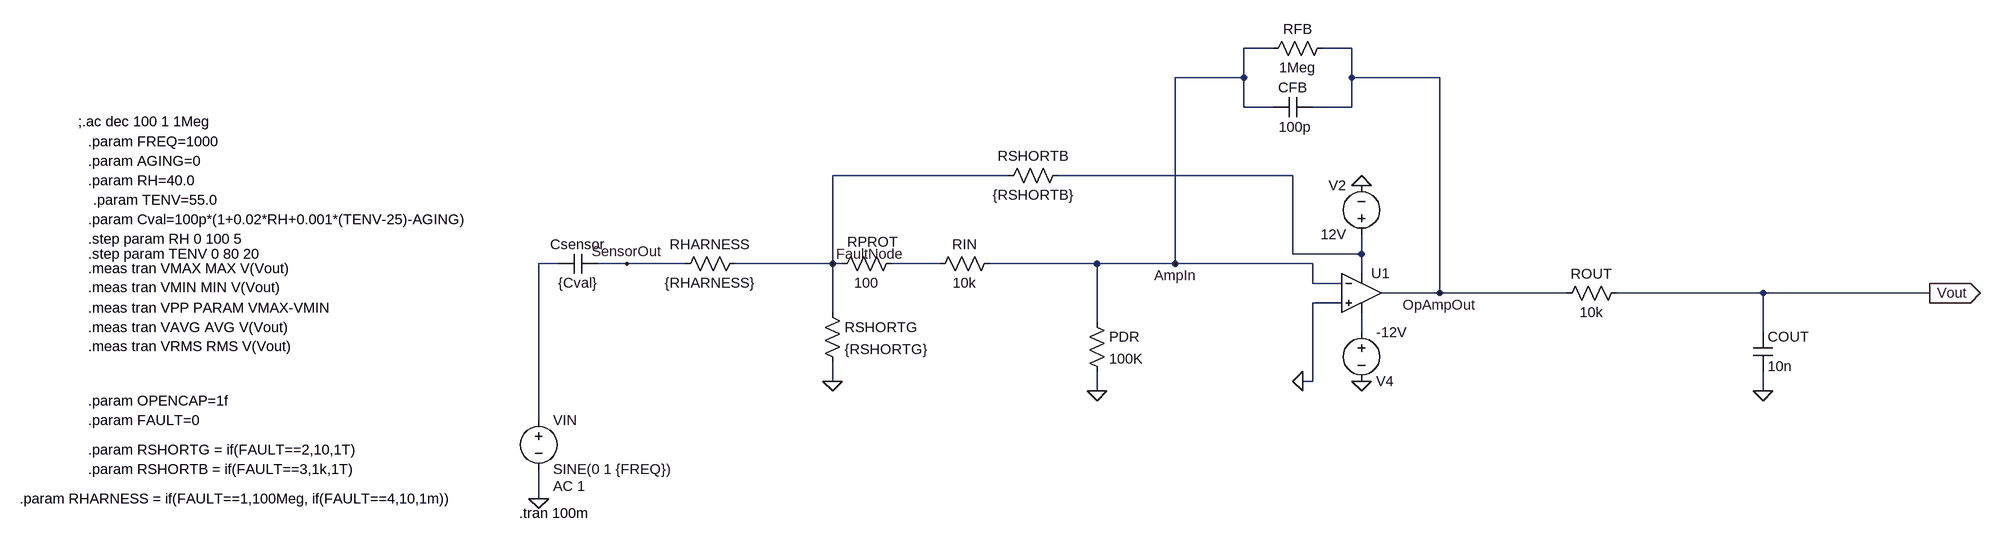
[diagram p0: schematic HumiditySensor_AFE_v5.asc]
HumiditySensor_AFE_v5.asc, the LTspice schematic file:
Version 4.1
SHEET 1 1540 680
WIRE 80 -288 32 -288
WIRE 208 -288 160 -288
WIRE 32 -240 32 -288
WIRE 32 -240 -80 -240
WIRE 208 -240 208 -288
WIRE 352 -240 208 -240
WIRE 32 -192 32 -240
WIRE 80 -192 32 -192
WIRE 208 -192 208 -240
WIRE 208 -192 144 -192
WIRE -352 -80 -640 -80
WIRE 112 -80 -272 -80
WIRE 112 48 112 -80
WIRE 224 48 224 16
WIRE 224 48 112 48
WIRE -1088 64 -1120 64
WIRE -976 64 -1024 64
WIRE -880 64 -976 64
WIRE -640 64 -640 -80
WIRE -640 64 -800 64
WIRE -624 64 -640 64
WIRE -464 64 -544 64
WIRE -208 64 -384 64
WIRE -80 64 -80 -240
WIRE -80 64 -208 64
WIRE 144 64 -80 64
WIRE 224 80 224 48
WIRE 144 96 144 64
WIRE 192 96 144 96
WIRE 352 112 352 -240
WIRE 352 112 256 112
WIRE 560 112 352 112
WIRE 880 112 640 112
WIRE 1152 112 880 112
WIRE 192 128 144 128
WIRE -640 144 -640 64
WIRE -208 160 -208 64
WIRE 224 176 224 144
WIRE 880 176 880 112
WIRE -640 256 -640 224
WIRE 144 256 144 128
WIRE 144 256 128 256
WIRE -208 272 -208 240
WIRE 880 272 880 240
WIRE -1120 320 -1120 64
WIRE -1120 448 -1120 400
FLAG -1120 448 0
FLAG 880 272 0
FLAG 1152 112 Vout
IOPIN 1152 112 Out
FLAG 224 256 0
FLAG 224 -64 0
FLAG -208 272 0
FLAG -976 64 SensorOut
FLAG -640 64 FaultNode
FLAG -80 64 AmpIn
FLAG 352 112 OpAmpOut
FLAG 128 256 0
FLAG -640 256 0
SYMBOL voltage -1120 304 R0
WINDOW 123 24 124 Left 2
WINDOW 39 0 0 Left 0
SYMATTR Value2 AC 1
SYMATTR InstName VIN
SYMATTR Value SINE(0 1 {FREQ})
SYMBOL cap -1024 48 R90
WINDOW 0 0 32 VBottom 2
WINDOW 3 32 32 VTop 2
SYMATTR InstName Csensor
SYMATTR Value {Cval}
SYMBOL res -368 48 R90
WINDOW 0 0 56 VBottom 2
WINDOW 3 32 56 VTop 2
SYMATTR InstName RIN
SYMATTR Value 10k
SYMBOL OpAmps\\UniversalOpAmp2 224 112 R0
SYMATTR InstName U1
SYMBOL res 176 -304 R90
WINDOW 0 0 56 VBottom 2
WINDOW 3 32 56 VTop 2
SYMATTR InstName RFB
SYMATTR Value 1Meg
SYMBOL cap 144 -208 R90
WINDOW 0 0 32 VBottom 2
WINDOW 3 33 28 VTop 2
SYMATTR InstName CFB
SYMATTR Value 100p
SYMBOL res 656 96 R90
WINDOW 0 0 56 VBottom 2
WINDOW 3 32 56 VTop 2
SYMATTR InstName ROUT
SYMATTR Value 10k
SYMBOL cap 864 176 R0
SYMATTR InstName COUT
SYMATTR Value 10n
SYMBOL voltage 224 32 R180
WINDOW 0 24 96 Left 2
WINDOW 3 24 16 Left 2
WINDOW 123 0 0 Left 0
WINDOW 39 0 0 Left 0
SYMATTR InstName V2
SYMATTR Value 12V
SYMBOL voltage 224 160 R0
WINDOW 0 24 96 Left 2
WINDOW 3 24 16 Left 2
WINDOW 123 0 0 Left 0
WINDOW 39 0 0 Left 0
SYMATTR InstName V4
SYMATTR Value -12V
SYMBOL res -528 48 R90
WINDOW 0 -4 46 VBottom 2
WINDOW 3 32 56 VTop 2
SYMATTR InstName RPROT
SYMATTR Value 100
SYMBOL res -224 144 R0
SYMATTR InstName PDR
SYMATTR Value 100K
SYMBOL res -784 48 R90
WINDOW 0 0 56 VBottom 2
WINDOW 3 32 56 VTop 2
SYMATTR InstName RHARNESS
SYMATTR Value {RHARNESS}
SYMBOL res -656 128 R0
SYMATTR InstName RSHORTG
SYMATTR Value {RSHORTG}
SYMBOL res -256 -96 R90
WINDOW 0 0 56 VBottom 2
WINDOW 3 32 56 VTop 2
SYMATTR InstName RSHORTB
SYMATTR Value {RSHORTB}
TEXT -1152 472 Left 2 !.tran 100m
TEXT -1856 -72 Left 2 !.param RH=40.0
TEXT -1848 -40 Left 2 !.param TENV=55.0
TEXT -1856 72 Left 2 !.meas tran VMAX MAX V(Vout)\n.meas tran VMIN MIN V(Vout)
TEXT -1856 136 Left 2 !.meas tran VPP PARAM VMAX-VMIN
TEXT -1856 -104 Left 2 !.param AGING=0
TEXT -1856 -136 Left 2 !.param FREQ=1000
TEXT -1856 24 Left 2 !.step param RH 0 100 5
TEXT -1856 168 Left 2 !.meas tran VAVG AVG V(Vout)\n.meas tran VRMS RMS V(Vout)
TEXT -1872 -168 Left 2 !;.ac dec 100 1 1Meg
TEXT -1856 48 Left 2 !.step param TENV 0 80 20
TEXT -1856 288 Left 2 !.param OPENCAP=1f
TEXT -1856 320 Left 2 !.param FAULT=0
TEXT -1968 448 Left 2 !.param RHARNESS = if(FAULT==1,100Meg, if(FAULT==4,10,1m))
TEXT -1856 368 Left 2 !.param RSHORTG = if(FAULT==2,10,1T)
TEXT -1856 400 Left 2 !.param RSHORTB = if(FAULT==3,1k,1T)
TEXT -1856 -8 Left 2 !.param Cval=100p*(1+0.02*RH+0.001*(TENV-25)-AGING)

The netlist it stands for:
* HumiditySensor_AFE_v5.asc
VIN N002 0 SINE(0 1 {FREQ}) AC 1
Csensor SensorOut N002 {Cval}
RIN AmpIn N003 10k
X§U1 0 AmpIn N001 N004 OpAmpOut level2 Avol=1Meg GBW=10Meg Slew=10Meg Ilimit=25m Rail=0 Vos=0 En=0 Enk=0 In=0 Ink=0 Rin=500Meg  ; pins In+ In- V+ V- OUT
RFB OpAmpOut AmpIn 1Meg
CFB OpAmpOut AmpIn 100p
ROUT Vout OpAmpOut 10k
COUT Vout 0 10n
V2 N001 0 12V
V4 N004 0 -12V
RPROT N003 FaultNode 100
R§PDR AmpIn 0 100K
RHARNESS FaultNode SensorOut {RHARNESS}
RSHORTG FaultNode 0 {RSHORTG}
RSHORTB N001 FaultNode {RSHORTB}
.tran 100m
.param RH=40.0
.param TENV=55.0
.meas tran VMAX MAX V(Vout)
.meas tran VMIN MIN V(Vout)
.meas tran VPP PARAM VMAX-VMIN
.param AGING=0
.param FREQ=1000
.step param RH 0 100 5
.meas tran VAVG AVG V(Vout)
.meas tran VRMS RMS V(Vout)
;.ac dec 100 1 1Meg
.step param TENV 0 80 20
.param OPENCAP=1f
.param FAULT=0
.param RHARNESS = if(FAULT==1,100Meg, if(FAULT==4,10,1m))
.param RSHORTG = if(FAULT==2,10,1T)
.param RSHORTB = if(FAULT==3,1k,1T)
.param Cval=100p*(1+0.02*RH+0.001*(TENV-25)-AGING)
.lib UniversalOpAmp2.lib
.backanno
.end